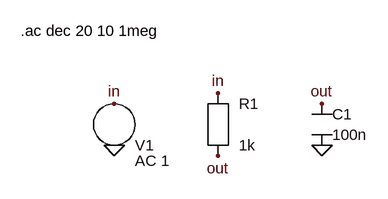
[diagram p0: schematic rc_lowpass_labelled.asc]
rc_lowpass_labelled.asc, the LTspice schematic file:
Version 4
SHEET 1 880 680
FLAG 160 128 in
FLAG 160 192 0
FLAG 320 112 in
FLAG 320 208 out
FLAG 480 128 out
FLAG 480 192 0
SYMBOL voltage 160 160 R0
SYMATTR InstName V1
SYMATTR Value AC 1
SYMBOL res 320 160 R0
SYMATTR InstName R1
SYMATTR Value 1k
SYMBOL cap 480 160 R0
SYMATTR InstName C1
SYMATTR Value 100n
TEXT 16 16 Left 2 !.ac dec 20 10 1meg

The netlist it stands for:
* rc_lowpass_labelled.asc
V1 in 0 AC 1
R1 in out 1k
C1 out 0 100n
.ac dec 20 10 1meg
.backanno
.end